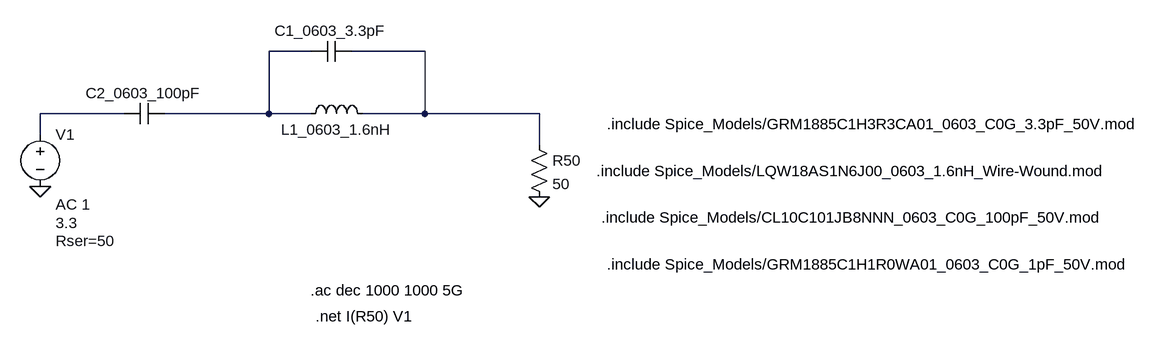
[diagram p0: schematic 2nd_Harmonic_Band_Reject_Filter_Real.asc]
2nd_Harmonic_Band_Reject_Filter_Real.asc, the LTspice schematic file:
Version 4.1
SHEET 1 1500 680
WIRE 176 -48 112 -48
WIRE 352 -48 240 -48
WIRE -112 48 -240 48
WIRE 112 48 112 -48
WIRE 112 48 -48 48
WIRE 176 48 112 48
WIRE 352 48 352 -48
WIRE 352 48 256 48
WIRE 528 48 352 48
WIRE -240 80 -240 48
WIRE 528 96 528 48
FLAG -240 160 0
FLAG 528 176 0
SYMBOL ind 160 64 R270
WINDOW 0 -24 57 VTop 2
WINDOW 3 5 56 Invisible 2
SYMATTR InstName L1_0603_1.6nH
SYMATTR Value LQW18AS1N6J00
SYMATTR Prefix X
SYMBOL cap 240 -64 R90
WINDOW 0 0 32 VBottom 2
WINDOW 3 32 32 Invisible 2
SYMATTR InstName C1_0603_3.3pF
SYMATTR Value GRM1885C1H3R3CA01_DC0V_25degC
SYMATTR Prefix X
SYMBOL voltage -240 64 R0
WINDOW 3 24 152 Left 2
WINDOW 123 24 124 Left 2
WINDOW 39 24 180 Left 2
SYMATTR Value 3.3
SYMATTR Value2 AC 1
SYMATTR SpiceLine Rser=50
SYMATTR InstName V1
SYMBOL res 512 80 R0
SYMATTR InstName R50
SYMATTR Value 50
SYMBOL cap -48 32 R90
WINDOW 0 0 32 VBottom 2
WINDOW 3 32 32 Invisible 2
SYMATTR InstName C2_0603_100pF
SYMATTR Value CL10C101JB8NNN_Precise_DC0V_25degC
SYMATTR Prefix X
TEXT 176 320 Left 2 !.ac dec 1000 1000 5G
TEXT 616 136 Left 2 !.include Spice_Models/LQW18AS1N6J00_0603_1.6nH_Wire-Wound.mod
TEXT 632 64 Left 2 !.include Spice_Models/GRM1885C1H3R3CA01_0603_C0G_3.3pF_50V.mod
TEXT 624 208 Left 2 !.include Spice_Models/CL10C101JB8NNN_0603_C0G_100pF_50V.mod
TEXT 184 360 Left 2 !.net I(R50) V1
TEXT 632 280 Left 2 !.include Spice_Models/GRM1885C1H1R0WA01_0603_C0G_1pF_50V.mod

The netlist it stands for:
* 2nd_Harmonic_Band_Reject_Filter_Real.asc
X§L1_0603_1.6nH N001 N002 LQW18AS1N6J00  ; pins A B
X§C1_0603_3.3pF N002 N001 GRM1885C1H3R3CA01_DC0V_25degC  ; pins A B
V1 N003 0 3.3 AC 1 Rser=50
R50 N002 0 50
X§C2_0603_100pF N001 N003 CL10C101JB8NNN_Precise_DC0V_25degC  ; pins A B
.ac dec 1000 1000 5G
.include Spice_Models/LQW18AS1N6J00_0603_1.6nH_Wire-Wound.mod
.include Spice_Models/GRM1885C1H3R3CA01_0603_C0G_3.3pF_50V.mod
.include Spice_Models/CL10C101JB8NNN_0603_C0G_100pF_50V.mod
.net I(R50) V1
.include Spice_Models/GRM1885C1H1R0WA01_0603_C0G_1pF_50V.mod
.backanno
.end